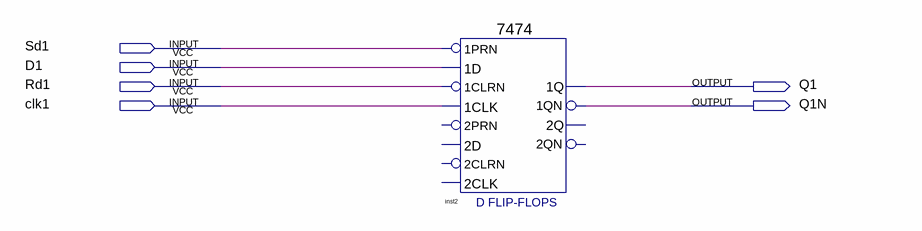
[diagram p0: schematic sheet]
// Quartus schematic exp5_t1_7474.bdf as structural Verilog: 1 symbols, 6 pins
module exp5_t1_7474 (
  input  Sd1,
  input  D1,
  input  Rd1,
  input  clk1,
  output Q1,
  output Q1N
);

  \7474  inst2 (
    .\1CLK (clk1), .\1D (D1), .\1PRN (Sd1), .\1CLRN (Rd1), .\1QN (Q1N), .\1Q (Q1));  // open: 2D, 2PRN, 2CLK, 2CLRN, 2Q, 2QN
endmodule
